# Altium schematic sheet Sheet1.SchDoc
size A4; SheetNumber: 1; SheetTotal: 1
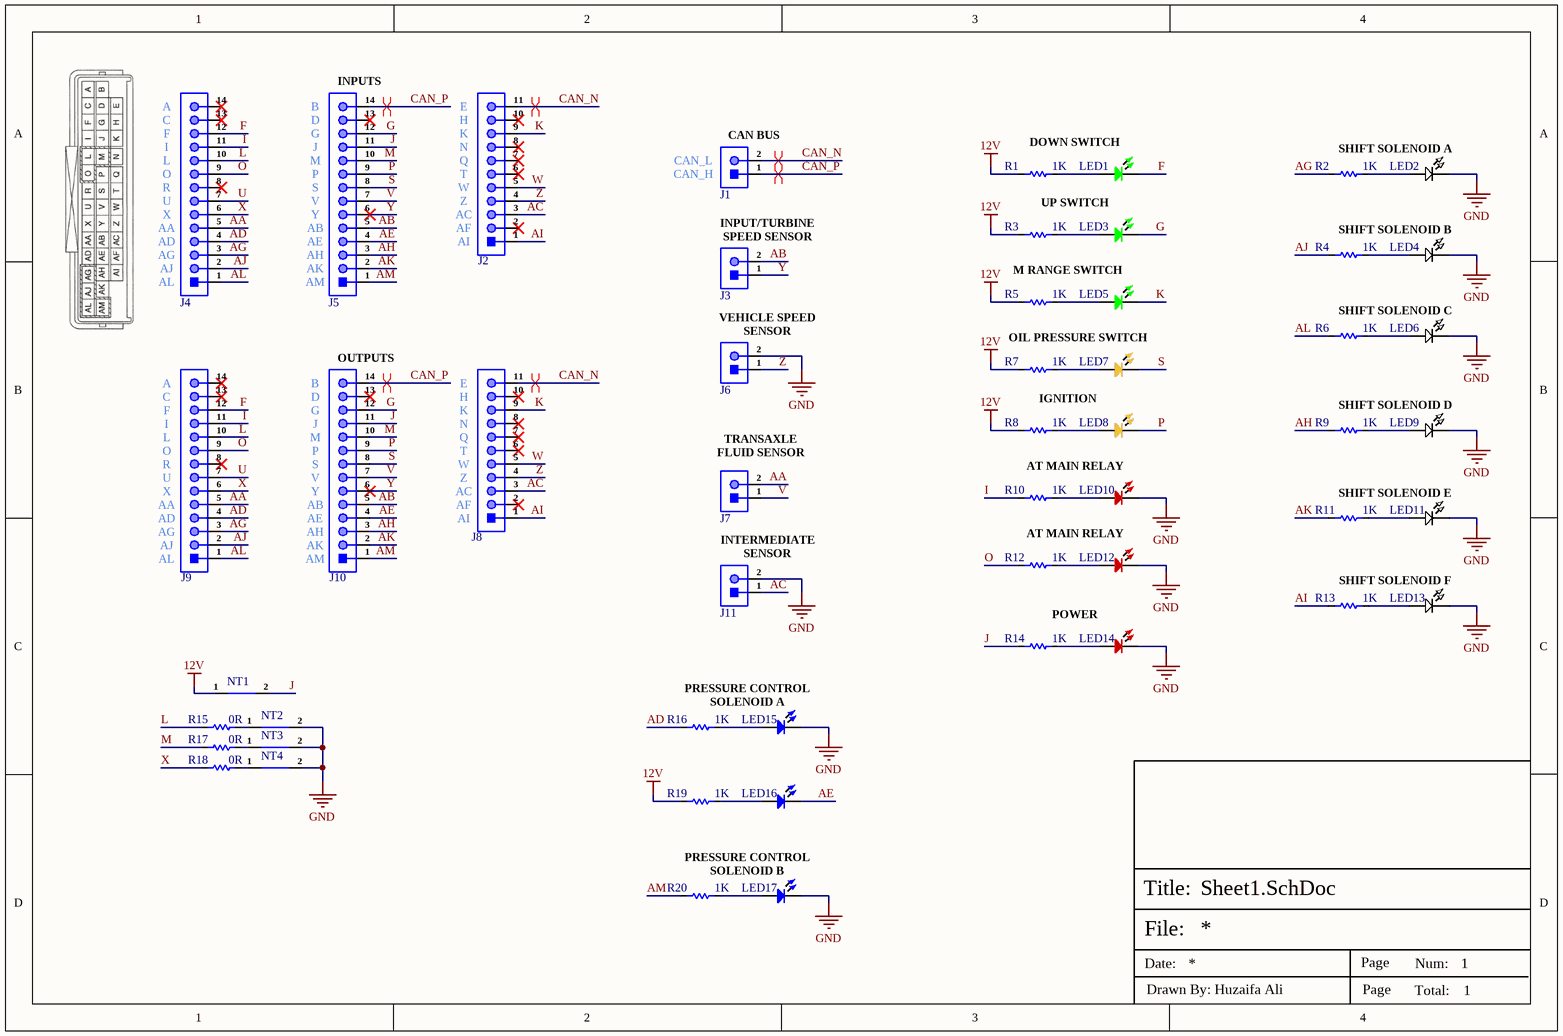
[diagram p0: Sheet1.SchDoc]

## Parts
J1  X6511WV-02H-C60D30  [HDR1X2_]  (value not drawn)
J2  X6511WV-11H-C60D30  [HDR 1X11 male]  (value not drawn)
J3  X6511WV-02H-C60D30  [HDR1X2_]  (value not drawn)
J4  X6511WV-14H-C60D30  [HDR 1x14 TH Male]  (value not drawn)
J5  X6511WV-14H-C60D30  [HDR 1x14 TH Male]  (value not drawn)
J6  X6511WV-02H-C60D30  [HDR1X2_]  (value not drawn)
J7  X6511WV-02H-C60D30  [HDR1X2_]  (value not drawn)
J8  X6511FV-11-C85D32  [HDR 1x11 TH (Female)]  (value not drawn)
J9  X6511FV-14-C85D32  [HDR 1x14 TH (Female)]  (value not drawn)
J10  X6511FV-14-C85D32  [HDR 1x14 TH (Female)]  (value not drawn)
J11  X6511WV-02H-C60D30  [HDR1X2_]  (value not drawn)
LED1  NFD5408UGD  [TH LED 5mm Green]  (value not drawn)
LED2  NFD5408WC  [TH LED 5mm White]  (value not drawn)
LED3  NFD5408UGD  [TH LED 5mm Green]  (value not drawn)
LED4  NFD5408WC  [TH LED 5mm White]  (value not drawn)
LED5  NFD5408UGD  [TH LED 5mm Green]  (value not drawn)
LED6  NFD5408WC  [TH LED 5mm White]  (value not drawn)
LED7  NFD5408UYD  [TH LED 5mm Yellow]  (value not drawn)
LED8  NFD5408UYD  [TH LED 5mm Yellow]  (value not drawn)
LED9  NFD5408WC  [TH LED 5mm White]  (value not drawn)
LED10  NFD5408URD  [TH LED 5mm_]  (value not drawn)
LED11  NFD5408WC  [TH LED 5mm White]  (value not drawn)
LED12  NFD5408URD  [TH LED 5mm_]  (value not drawn)
LED13  NFD5408WC  [TH LED 5mm White]  (value not drawn)
LED14  NFD5408URD  [TH LED 5mm_]  (value not drawn)
LED15  NFD5408BC  [TH LED 5mm Blue]  (value not drawn)
LED16  NFD5408BC  [TH LED 5mm Blue]  (value not drawn)
LED17  NFD5408BC  [TH LED 5mm Blue]  (value not drawn)
NT1  Net Tie_SMD  [Net Tie Pad]  (value not drawn)  (net tie, no BOM)
NT2  Net Tie_SMD  [Net Tie Pad]  (value not drawn)  (net tie, no BOM)
NT3  Net Tie_SMD  [Net Tie Pad]  (value not drawn)  (net tie, no BOM)
NT4  Net Tie_SMD  [Net Tie Pad]  (value not drawn)  (net tie, no BOM)
R1  1K  [RES-0805]
R2  1K  [RES-0805]
R3  1K  [RES-0805]
R4  1K  [RES-0805]
R5  1K  [RES-0805]
R6  1K  [RES-0805]
R7  1K  [RES-0805]
R8  1K  [RES-0805]
R9  1K  [RES-0805]
R10  1K  [RES-0805]
R11  1K  [RES-0805]
R12  1K  [RES-0805]
R13  1K  [RES-0805]
R14  1K  [RES-0805]
R15  0R  [Res-0805]
R16  1K  [RES-0805]
R17  0R  [Res-0805]
R18  0R  [Res-0805]
R19  1K  [RES-0805]
R20  1K  [RES-0805]

## Nets
12V: NT1.1 R1.1 R3.1 R5.1 R7.1 R8.1 R19.1
GND: J6.2 J11.2 LED2.1 LED4.1 LED6.1 LED9.1 LED10.1 LED11.1 LED12.1 LED13.1 LED14.1 LED15.1 LED17.1 NT2.2 NT3.2 NT4.2
AA: J4.5 J7.2 J9.5
AB: J3.2 J5.5 J10.5
AC: J2.3 J8.3 J11.1
AD: J4.4 J9.4 R16.1
AE: J5.4 J10.4 LED16.1
AG: J4.3 J9.3 R2.1
AH: J5.3 J10.3 R9.1
AI: J2.1 J8.1 R13.1
AJ: J4.2 J9.2 R4.1
AK: J5.2 J10.2 R11.1
AL: J4.1 J9.1 R6.1
AM: J5.1 J10.1 R20.1
CAN_N: J1.2 J2.11 J8.11
CAN_P: J1.1 J5.14 J10.14
F: J4.12 J9.12 LED1.1
G: J5.12 J10.12 LED3.1
I: J4.11 J9.11 R10.1
J: J5.11 J10.11 NT1.2 R14.1
K: J2.9 J8.9 LED5.1
L: J4.10 J9.10 R15.1
M: J5.10 J10.10 R17.1
O: J4.9 J9.9 R12.1
P: J5.9 J10.9 LED8.1
S: J5.8 J10.8 LED7.1
U: J4.7 J9.7
V: J5.7 J7.1 J10.7
W: J2.5 J8.5
X: J4.6 J9.6 R18.1
Y: J3.1 J5.6 J10.6
Z: J2.4 J6.1 J8.4
NetLED1_2: LED1.2 R1.2
NetLED2_2: LED2.2 R2.2
NetLED3_2: LED3.2 R3.2
NetLED4_2: LED4.2 R4.2
NetLED5_2: LED5.2 R5.2
NetLED6_2: LED6.2 R6.2
NetLED7_2: LED7.2 R7.2
NetLED8_2: LED8.2 R8.2
NetLED9_2: LED9.2 R9.2
NetLED10_2: LED10.2 R10.2
NetLED11_2: LED11.2 R11.2
NetLED12_2: LED12.2 R12.2
NetLED13_2: LED13.2 R13.2
NetLED14_2: LED14.2 R14.2
NetLED15_2: LED15.2 R16.2
NetLED16_2: LED16.2 R19.2
NetLED17_2: LED17.2 R20.2
NetNT2_1: NT2.1 R15.2
NetNT3_1: NT3.1 R17.2
NetNT4_1: NT4.1 R18.2

Not connected (* = marked no-connect by the designer): J2 2* 6* 7* 8* 10*; J4 8* 13* 14*; J5 13*; J8 2* 6* 7* 8* 10*; J9 8* 13* 14*; J10 13*

## Layout directives
differential pair; rule Impedance Constraint [Min = 117.0    Max = 123.0    ]; differential pair class CAN: CAN_N, CAN_P

## Notes on the sheet
- (near J4) A
- (near J4) C
- INPUTS
- (near J5) B
- (near J5) D
- (near J2) E
- (near J2) H
- (near J4) F
- (near J4) I
- (near J4) L
- (near J4) O
- (near J5) G
- (near J5) J
- (near J5) M
- (near J5) P
- (near J2) K
- (near J2) N
- (near J2) Q
- (near J2) T
- (near J1) CAN_H
- (near J1) CAN_L
- (near J1) CAN BUS
- DOWN SWITCH
- SHIFT SOLENOID A
- (near J4) R
- (near J4) U
- (near J4) X
- (near J4) AA
- (near J4) AD
- (near J4) AG
- (near J5) S
- (near J5) V
- (near J5) Y
- (near J5) AB
- (near J5) AE
- (near J5) AH
- (near J2) W
- (near J2) Z
- (near J2) AC
- (near J2) AF
- (near J2) AI
- (near J3) INPUT/TURBINE SPEED SENSOR
- UP SWITCH
- SHIFT SOLENOID B
- (near J4) AJ
- (near J4) AL
- (near J5) AK
- (near J5) AM
- M RANGE SWITCH
- SHIFT SOLENOID C
- (near J9) A
- OUTPUTS
- (near J10) B
- (near J8) E
- VEHICLE SPEED SENSOR
- OIL PRESSURE SWITCH
- (near J9) C
- (near J9) F
- (near J9) I
- (near J9) L
- (near J9) O
- (near J10) D
- (near J10) G
- (near J10) J
- (near J10) M
- (near J10) P
- (near J8) H
- (near J8) K
- (near J8) N
- (near J8) Q
- (near J8) T
- IGNITION
- SHIFT SOLENOID D
- (near J9) R
- (near J9) U
- (near J9) X
- (near J9) AA
- (near J9) AD
- (near J10) S
- (near J10) V
- (near J10) Y
- (near J10) AB
- (near J10) AE
- (near J8) W
- (near J8) Z
- (near J8) AC
- (near J8) AF
- (near J8) AI
- (near J7) TRANSAXLE FLUID SENSOR
- AT MAIN RELAY
- SHIFT SOLENOID E
- (near J9) AG
- (near J9) AJ
- (near J9) AL
- (near J10) AH
- (near J10) AK
- (near J10) AM
- INTERMEDIATE SENSOR
- SHIFT SOLENOID F
- POWER
- PRESSURE CONTROL SOLENOID A
- PRESSURE CONTROL SOLENOID B
- File:
- Title:
- Date:
- Page
- Num:
- Total:
- Drawn By: Huzaifa Ali

## Library data of the parts
J1 J3 J6 J7 J11 = X6511WV-02H-C60D30: Gold 250V 3A Straight Square Pins 2.5mm 2P 260℃ 6mm -40℃~+105℃ 3mm 2.54mm Plugin Black Brass 1x2P Plugin,P=2.54mm Pin Headers ROHS; Manufacturer: XKB; Item Type: Male Header; Manufacturer Part Number: X6511WV-02H-C60D30; Package: Plugin,P=2.54mm; LCSC Part Number: C706874; ComponentLink1Description: LCSC; ComponentLink1URL: https://www.lcsc.com/product-detail/Pin-Headers_XKB-Connectivity-X6511WV-02H-C60D30_C706874.html
J2 = X6511WV-11H-C60D30: Gold 250V 3A Policy 2.5mm 11P 260℃ -40℃~+105℃ 2.54mm Single Row Black Brass 1x11P 2.54mm Plugin,P=2.54mm Pin Headers ROHS; Manufacturer: XKB; Item Type: Male Header; Manufacturer Part Number: X6511WV-11H-C60D30; Package: Plugin,P=2.54mm; LCSC Part Number: C725943; ComponentLink1Description: LCSC; ComponentLink1URL: https://www.lcsc.com/product-detail/Pin-Headers_XKB-Connection-X6511WV-11H-C60D30_C725943.html
J4 J5 = X6511WV-14H-C60D30: Gold 250V 3A Policy 2.5mm 14P 260℃ -40℃~+105℃ 2.54mm Single Row Black Brass 2.54mm 1x14P Plugin,P=2.54mm Pin Headers ROHS; Manufacturer: XKB; Item Type: Male Header; Manufacturer Part Number: X6511WV-14H-C60D30; Package: Plugin,P=2.54mm; LCSC Part Number: C725946; ComponentLink1Description: LCSC; ComponentLink1URL: https://www.lcsc.com/product-detail/Pin-Headers_XKB-Connection-X6511WV-14H-C60D30_C725946.html
J8 = X6511FV-11-C85D32: 2.54mm Single Row Gold 3A 11P Brass -40℃~+105℃ 250V 260℃ Direct Insert 1x11P 8.5mm Top Square Hole Plugin,P=2.54mm Female Headers ROHS; Manufacturer: XKB Connectivity; Supplier: LCSC; LCSC Part Number: C2883728; Manufacturer Part Number: X6511FV-11-C85D32; RoHS: No; Item Type: Female Header; ComponentLink1Description: LCSC; ComponentLink1URL: https://www.lcsc.com/product-detail/Female-Headers_XKB-Connection-X6511FV-11-C85D32_C2883728.html
J9 J10 = X6511FV-14-C85D32: 2.54mm Single Row Gold 3A 14P Brass -40℃~+105℃ 250V 260℃ Direct Insert 1x14P 8.5mm Top Square Hole Plugin,P=2.54mm Female Headers ROHS; Manufacturer: XKB Connectivity; Item Type: Header; LCSC Part Number: C2883731; Manufacturer Part Number: X6511FV-14-C85D32
LED1 LED3 LED5 = NFD5408UGD: 515nm~525nm -30℃~+85℃ Emerald 30° 200mW Plugin,D=5mm LED Indication - Discrete ROHS; Manufacturer: Foshan; Manufacturer Part Number: NFD5408UGD; Package: Plugin,D=5mm; LCSC Part Number: C20618157; Item Type: LED; ComponentLink1Description: LCSC; ComponentLink1URL: https://www.lcsc.com/product-detail/LED-Indication-Discrete_Foshan-NationStar-Optoelectronics-NFD5408UGD_C20618157.html
LED2 LED4 LED6 LED9 LED11 LED13 = NFD5408WC: -30℃~+85℃ White 20° 200mW Plugin,D=5mm LED Indication - Discrete ROHS; Manufacturer: Foshan; Manufacturer Part Number: NFD5408WC; Package: Plugin,D=5mm; LCSC Part Number: C20618159; Item Type: LED; ComponentLink1Description: LCSC; ComponentLink1URL: https://www.lcsc.com/product-detail/LED-Indication-Discrete_Foshan-NationStar-Optoelectronics-NFD5408WC_C20618159.html
LED7 LED8 = NFD5408UYD: 585nm~595nm -30℃~+85℃ Yellow 30° 200mW Plugin,D=5mm LED Indication - Discrete ROHS; Manufacturer: Foshan; Manufacturer Part Number: NFD5408UYD; Package: Plugin,D=5mm; LCSC Part Number: C20618155; Item Type: LED; ComponentLink1Description: LCSC; ComponentLink1URL: https://www.lcsc.com/product-detail/LED-Indication-Discrete_Foshan-NationStar-Optoelectronics-NFD5408UYD_C20618155.html
LED10 LED12 LED14 = NFD5408URD: 620nm~630nm -30℃~+85℃ Red 30° 200mW Plugin,D=5mm LED Indication - Discrete ROHS; Manufacturer: Foshan; Manufacturer Part Number: NFD5408URD; Package: Plugin,D=5mm; LCSC Part Number: C20618154; Item Type: LED; ComponentLink1Description: LCSC; ComponentLink1URL: https://www.lcsc.com/product-detail/LED-Indication-Discrete_Foshan-NationStar-Optoelectronics-NFD5408URD_C20618154.html
LED15-LED17 = NFD5408BC: 460nm~470nm -30℃~+85℃ Blue 20° 200mW Plugin,D=5mm LED Indication - Discrete ROHS; Manufacturer: Foshan; Manufacturer Part Number: NFD5408BC; Package: Plugin,D=5mm; LCSC Part Number: C20618158; Item Type: LED; ComponentLink1Description: LCSC; ComponentLink1URL: https://www.lcsc.com/product-detail/LED-Indication-Discrete_Foshan-NationStar-Optoelectronics-NFD5408BC_C20618158.html
NT1-NT4 = Net Tie_SMD: Net Tie SMD; Manufacturer Part Number: Net Tie; Item Type: Net Tie Pad
R1-R14 R16 R19 R20 = RC0805FR-071KL: RES 1K OHM 1% 1/8W 0805; Manufacturer: Yageo; Value: 1kR; Voltage Rating (DC): 150V; Temperature Coefficient: 100ppm/°C; Power Rating: 125mW; Item Type: Resistor; Supplier: Future Electronics; Supplier Part Number: 8126013; Manufacturer Part Number: RC0805FR-071KL; RoHS: Yes; Category: Chip SMD Resistors; Stock: 8305000; Pricing: 5000=0.117, 25000=0.112, 125000=0.107, 500000=0.104, 1250000=0.0981 (USD); Case/Package: 0805; Pins: 2; Case Code (Metric): 2012; Case Code (Imperial): 0805; Min Operating Temperature: -55°C; Max Operating Temperature: 155°C; Tolerance: 1%; Packaging: Tape and Reel; Resistor Type: Thick Film; Package Quantity: 1; Voltage Rating: 150V; Termination: SMD/SMT; Series: RC; Number of Terminations: 2; Max Power Dissipation: 125mW; Features: Moisture Resistant; Resistance Tolerance: 1%; Construction: Rectangular; Voltage Rating (AC): 150V; Length: 0.079inch; Width: 0.049inch; Height: 0.024inch; Depth: 1.25mm; Reach SVHC Compliant: No; Lead Free: 5697LeadFree; RoHS Compliant: Yes; Military Standard: Not; ComponentLink1URL: https://datasheet.ciiva.com/7941/1686128-7941719.pdf?src-supplier=Element14; ComponentLink1Description: https://datasheet.ciiva.com/7941/1686128-7941719.pdf?src-supplier=Element14; ComponentLink2URL: https://datasheet.ciiva.com/46385/444164-46385020.pdf?src-supplier=Element14; ComponentLink2Description: https://datasheet.ciiva.com/46385/444164-46385020.pdf?src-supplier=Element14; ComponentLink3URL: https://datasheet.ciiva.com/2456/pyu-r-int-thick-7-2456976.pdf?src-supplier=Digi-Key; ComponentLink3Description: https://datasheet.ciiva.com/2456/pyu-r-int-thick-7-2456976.pdf?src-supplier=Digi-Key; ComponentLink4URL: https://datasheet.ciiva.com/2456/pyu-r-int-thick-7-2456977.pdf?src-supplier=Digi-Key; ComponentLink4Description: https://datasheet.ciiva.com/2456/pyu-r-int-thick-7-2456977.pdf?src-supplier=Digi-Key; ComponentLink5URL: https://datasheet.ciiva.com/2456/pyu-r-int-thick-7-2456975.pdf?src-supplier=Digi-Key; ComponentLink5Description: https://datasheet.ciiva.com/2456/pyu-r-int-thick-7-2456975.pdf?src-supplier=Digi-Key; ComponentLink6URL: https://datasheet.ciiva.com/16850/rc0805-16850409.pdf?src-supplier=Future+Electronics; ComponentLink6Description: https://datasheet.ciiva.com/16850/rc0805-16850409.pdf?src-supplier=Future+Electronics; LCSC Part Number: C95781
R15 R17 R18 = RC0805FR-070RL: RES 0 OHM JUMPER 1/8W 0805; Manufacturer: Yageo; Resistance: 0mR; Tolerance: 1%; Power Rating: 125mW; Item Type: Resistor; Supplier 1: Avnet; Manufacturer Part Number: RC0805FR-070RL; RoHS: Yes; Category: Chip SMD Resistors; Stock 1: 85000; Pricing 1: 5000=0.00281, 10000=0.00277, 20000=0.00269 (USD); Case/Package: 0805; Contact Plating: Tin,Matte; Case Code (Imperial): 0805; Case Code (Metric): 2012; Size Code: 0805; Min Operating Temperature: -55°C; Max Operating Temperature: 155°C; Resistor Type: Thick Film; Packaging: Tape and Reel; Features: Moisture Resistant; Series: RC; Max Power Dissipation: 125mW; Number of Terminations: 2; Construction: Rectangular; Length: 2mm; Depth: 1.25mm; Radiation Hardening: No; Military Standard: Not; Lead Free: Lead Free; RoHS Compliant: Yes; ComponentLink1URL: https://datasheet.ciiva.com/15189/getdatasheetpartid-348154-15189885.pdf?src-supplier=Verical; ComponentLink1Description: https://datasheet.ciiva.com/15189/getdatasheetpartid-348154-15189885.pdf?src-supplier=Verical; ComponentLink2URL: https://datasheet.ciiva.com/17042/rc0805-17042698.pdf?src-supplier=Future+Electronics; ComponentLink2Description: https://datasheet.ciiva.com/17042/rc0805-17042698.pdf?src-supplier=Future+Electronics; Supplier Part Number 1: RC0805FR-070RL; LCSC Part Number: C100045